# Altium project Baseboard-v3.1.PrjPcb (part 1 of 8)
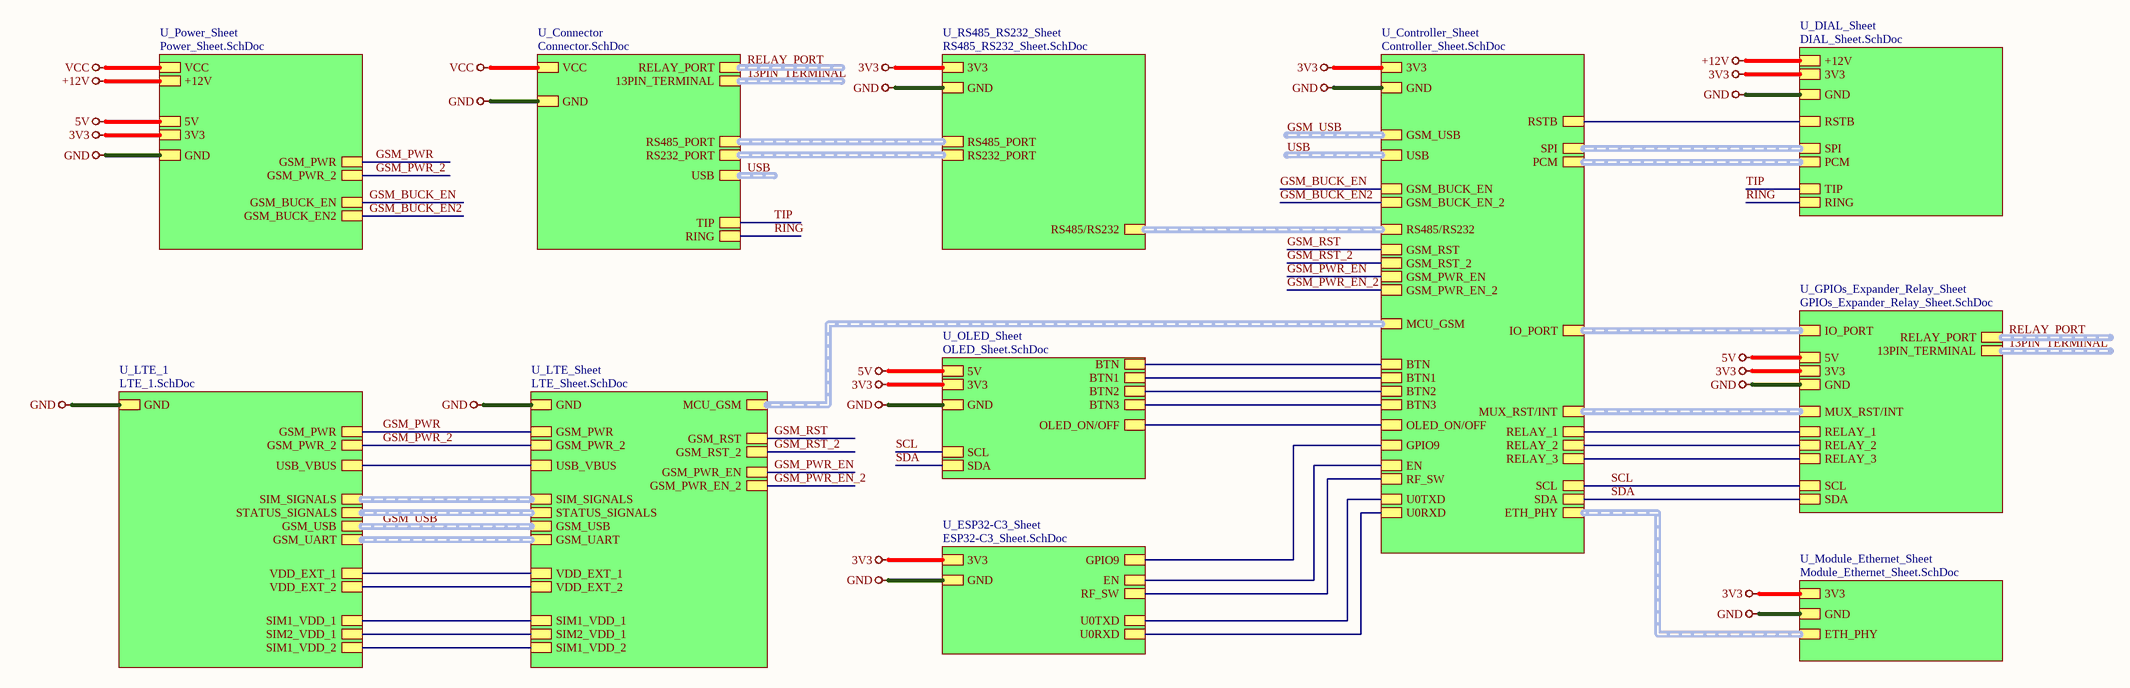
[diagram p0: Top_Sheet.SchDoc]
12 sheets, 417 parts. Net scope: hierarchical (ports join the sheet entries above them; power ports are global).
Board files: Baseboard-Development.PcbDoc, Baseboard-SupervisorCore.PcbDoc, Baseboard-SupervisorDuo.PcbDoc, Baseboard-SupervisorElite.PcbDoc
Sheets:
  Top_Sheet.SchDoc
    U_Connector = Connector.SchDoc
    U_GPIOs_Expander_Relay_Sheet = GPIOs_Expander_Relay_Sheet.SchDoc
    U_OLED_Sheet = OLED_Sheet.SchDoc
    U_Power_Sheet = Power_Sheet.SchDoc
    U_RS485_RS232_Sheet = RS485_RS232_Sheet.SchDoc
    U_Controller_Sheet = Controller_Sheet.SchDoc
    U_LTE_Sheet = LTE_Sheet.SchDoc
    U_LTE_1 = LTE_1.SchDoc
    U_ESP32-C3_Sheet = ESP32-C3_Sheet.SchDoc
    U_DIAL_Sheet = DIAL_Sheet.SchDoc
    U_Module_Ethernet_Sheet = Module_Ethernet_Sheet.SchDoc

## Sheet Top_Sheet.SchDoc
size 420 x 297 mm; SheetNumber: 1; SheetTotal: 12

### Sub-sheets
U_Connector = Connector.SchDoc: VCC, GND, RS485_PORT (harness RS485_PORT), RS232_PORT (harness RS232_PORT), RELAY_PORT (harness RELAY_PORT), 13PIN_TERMINAL (harness 13PIN_TERMINAL), TIP, RING, USB (harness USB)
U_Controller_Sheet = Controller_Sheet.SchDoc: RS485/RS232 (harness RS485/RS232), GND, 3V3, MUX_RST/INT (harness MUX_RST/INT), GSM_USB (harness GSM_USB), ETH_PHY (harness ETH_PHY), GSM_BUCK_EN, GSM_PWR_EN, GSM_RST, RELAY_1, RELAY_2, RELAY_3, MCU_GSM (harness MCU_GSM), GSM_BUCK_EN_2, GSM_PWR_EN_2, GSM_RST_2, RF_SW, EN, BTN1, BTN2, BTN3, OLED_ON/OFF, SCL, SDA, U0RXD, U0TXD, SPI (harness SPI), IO_PORT (harness IO_PORT), PCM (harness PCM), GPIO9, BTN, USB (harness USB), RSTB
U_DIAL_Sheet = DIAL_Sheet.SchDoc: GND, 3V3, +12V, SPI (harness SPI), TIP, RING, PCM (harness PCM), RSTB
U_ESP32-C3_Sheet = ESP32-C3_Sheet.SchDoc: GPIO9, RF_SW, EN, U0RXD, U0TXD, 3V3, GND
U_GPIOs_Expander_Relay_Sheet = GPIOs_Expander_Relay_Sheet.SchDoc: 3V3, GND, 5V, RELAY_PORT (harness RELAY_PORT), 13PIN_TERMINAL (harness 13PIN_TERMINAL), MUX_RST/INT (harness MUX_RST/INT), RELAY_1, RELAY_2, RELAY_3, SCL, SDA, IO_PORT (harness PCM)
U_LTE_1 = LTE_1.SchDoc: SIM_SIGNALS (harness SIM_SIGNALS), SIM1_VDD_1, STATUS_SIGNALS (harness STATUS_SIGNALS), GSM_UART (harness GSM_UART), GSM_PWR, GSM_USB (harness GSM_USB), VDD_EXT_1, GND, USB_VBUS, GSM_PWR_2, SIM2_VDD_1, VDD_EXT_2, SIM1_VDD_2
U_LTE_Sheet = LTE_Sheet.SchDoc: SIM_SIGNALS (harness SIM_SIGNALS), GSM_UART (harness GSM_UART), GSM_PWR, MCU_GSM (harness MCU_GSM), GSM_PWR_EN, GSM_RST, USB_VBUS, GND, STATUS_SIGNALS (harness STATUS_SIGNALS), GSM_PWR_EN_2, GSM_RST_2, GSM_PWR_2, GSM_USB (harness GSM_USB), VDD_EXT_1, VDD_EXT_2, SIM1_VDD_1, SIM2_VDD_1, SIM1_VDD_2
U_Module_Ethernet_Sheet = Module_Ethernet_Sheet.SchDoc: ETH_PHY (harness ETH_PHY), GND, 3V3
U_OLED_Sheet = OLED_Sheet.SchDoc: BTN1, BTN2, BTN3, 3V3, GND, OLED_ON/OFF, SCL, SDA, 5V, BTN
U_Power_Sheet = Power_Sheet.SchDoc: VCC, GND, GSM_BUCK_EN, GSM_PWR, 5V, 3V3, GSM_PWR_2, GSM_BUCK_EN2, +12V
U_RS485_RS232_Sheet = RS485_RS232_Sheet.SchDoc: GND, RS485_PORT (harness RS485_PORT), RS232_PORT (harness RS232_PORT), 3V3, RS485/RS232 (harness RS485/RS232)

### Nets
3V3: sheet U_GPIOs_Expander_Relay_Sheet/3V3, sheet U_OLED_Sheet/3V3, sheet U_Power_Sheet/3V3, sheet U_RS485_RS232_Sheet/3V3, sheet U_Controller_Sheet/3V3, sheet U_ESP32-C3_Sheet/3V3, sheet U_DIAL_Sheet/3V3, sheet U_Module_Ethernet_Sheet/3V3
5V: sheet U_GPIOs_Expander_Relay_Sheet/5V, sheet U_OLED_Sheet/5V, sheet U_Power_Sheet/5V
+12V: sheet U_Power_Sheet/+12V, sheet U_DIAL_Sheet/+12V
GND: sheet U_Connector/GND, sheet U_GPIOs_Expander_Relay_Sheet/GND, sheet U_OLED_Sheet/GND, sheet U_Power_Sheet/GND, sheet U_RS485_RS232_Sheet/GND, sheet U_Controller_Sheet/GND, sheet U_LTE_Sheet/GND, sheet U_LTE_1/GND, sheet U_ESP32-C3_Sheet/GND, sheet U_DIAL_Sheet/GND, sheet U_Module_Ethernet_Sheet/GND
GSM_PWR: sheet U_Power_Sheet/GSM_PWR, sheet U_LTE_Sheet/GSM_PWR, sheet U_LTE_1/GSM_PWR
GSM_PWR_2: sheet U_Power_Sheet/GSM_PWR_2, sheet U_LTE_Sheet/GSM_PWR_2, sheet U_LTE_1/GSM_PWR_2
SIM1_VDD_1: sheet U_LTE_Sheet/SIM1_VDD_1, sheet U_LTE_1/SIM1_VDD_1
SIM1_VDD_2: sheet U_LTE_Sheet/SIM1_VDD_2, sheet U_LTE_1/SIM1_VDD_2
SIM2_VDD_1: sheet U_LTE_Sheet/SIM2_VDD_1, sheet U_LTE_1/SIM2_VDD_1
USB_VBUS: sheet U_LTE_Sheet/USB_VBUS, sheet U_LTE_1/USB_VBUS
VCC: sheet U_Connector/VCC, sheet U_Power_Sheet/VCC
VDD_EXT_1: sheet U_LTE_Sheet/VDD_EXT_1, sheet U_LTE_1/VDD_EXT_1
VDD_EXT_2: sheet U_LTE_Sheet/VDD_EXT_2, sheet U_LTE_1/VDD_EXT_2
BTN: sheet U_OLED_Sheet/BTN, sheet U_Controller_Sheet/BTN
BTN1: sheet U_OLED_Sheet/BTN1, sheet U_Controller_Sheet/BTN1
BTN2: sheet U_OLED_Sheet/BTN2, sheet U_Controller_Sheet/BTN2
BTN3: sheet U_OLED_Sheet/BTN3, sheet U_Controller_Sheet/BTN3
EN: sheet U_Controller_Sheet/EN, sheet U_ESP32-C3_Sheet/EN
GPIO9: sheet U_Controller_Sheet/GPIO9, sheet U_ESP32-C3_Sheet/GPIO9
GSM_BUCK_EN: sheet U_Power_Sheet/GSM_BUCK_EN, sheet U_Controller_Sheet/GSM_BUCK_EN
GSM_BUCK_EN2: sheet U_Power_Sheet/GSM_BUCK_EN2, sheet U_Controller_Sheet/GSM_BUCK_EN_2
GSM_PWR_EN: sheet U_Controller_Sheet/GSM_PWR_EN, sheet U_LTE_Sheet/GSM_PWR_EN
GSM_PWR_EN_2: sheet U_Controller_Sheet/GSM_PWR_EN_2, sheet U_LTE_Sheet/GSM_PWR_EN_2
GSM_RST: sheet U_Controller_Sheet/GSM_RST, sheet U_LTE_Sheet/GSM_RST
GSM_RST_2: sheet U_Controller_Sheet/GSM_RST_2, sheet U_LTE_Sheet/GSM_RST_2
OLED_ON/OFF: sheet U_OLED_Sheet/OLED_ON/OFF, sheet U_Controller_Sheet/OLED_ON/OFF
RELAY_1: sheet U_GPIOs_Expander_Relay_Sheet/RELAY_1, sheet U_Controller_Sheet/RELAY_1
RELAY_2: sheet U_GPIOs_Expander_Relay_Sheet/RELAY_2, sheet U_Controller_Sheet/RELAY_2
RELAY_3: sheet U_GPIOs_Expander_Relay_Sheet/RELAY_3, sheet U_Controller_Sheet/RELAY_3
RF_SW: sheet U_Controller_Sheet/RF_SW, sheet U_ESP32-C3_Sheet/RF_SW
RING: sheet U_Connector/RING, sheet U_DIAL_Sheet/RING
RSTB: sheet U_Controller_Sheet/RSTB, sheet U_DIAL_Sheet/RSTB
SCL: sheet U_GPIOs_Expander_Relay_Sheet/SCL, sheet U_OLED_Sheet/SCL, sheet U_Controller_Sheet/SCL
SDA: sheet U_GPIOs_Expander_Relay_Sheet/SDA, sheet U_OLED_Sheet/SDA, sheet U_Controller_Sheet/SDA
TIP: sheet U_Connector/TIP, sheet U_DIAL_Sheet/TIP
U0RXD: sheet U_Controller_Sheet/U0RXD, sheet U_ESP32-C3_Sheet/U0RXD
U0TXD: sheet U_Controller_Sheet/U0TXD, sheet U_ESP32-C3_Sheet/U0TXD

### Buses and harness runs
harness 13PIN_TERMINAL = sheet U_Connector/13PIN_TERMINAL
harness 13PIN_TERMINAL = sheet U_GPIOs_Expander_Relay_Sheet/13PIN_TERMINAL
harness GSM_USB = sheet U_Controller_Sheet/GSM_USB
harness GSM_USB = sheet U_LTE_1/GSM_USB = sheet U_LTE_Sheet/GSM_USB
harness RELAY_PORT = sheet U_Connector/RELAY_PORT
harness RELAY_PORT = sheet U_GPIOs_Expander_Relay_Sheet/RELAY_PORT
harness sheet U_Connector/RS232_PORT = sheet U_RS485_RS232_Sheet/RS232_PORT
harness sheet U_Connector/RS485_PORT = sheet U_RS485_RS232_Sheet/RS485_PORT
harness sheet U_Controller_Sheet/ETH_PHY = sheet U_Module_Ethernet_Sheet/ETH_PHY
harness sheet U_Controller_Sheet/IO_PORT = sheet U_GPIOs_Expander_Relay_Sheet/IO_PORT
harness sheet U_Controller_Sheet/MCU_GSM = sheet U_LTE_Sheet/MCU_GSM
harness sheet U_Controller_Sheet/MUX_RST/INT = sheet U_GPIOs_Expander_Relay_Sheet/MUX_RST/INT
harness sheet U_Controller_Sheet/PCM = sheet U_DIAL_Sheet/PCM
harness sheet U_Controller_Sheet/RS485/RS232 = sheet U_RS485_RS232_Sheet/RS485/RS232
harness sheet U_Controller_Sheet/SPI = sheet U_DIAL_Sheet/SPI
harness sheet U_LTE_1/GSM_UART = sheet U_LTE_Sheet/GSM_UART
harness sheet U_LTE_1/SIM_SIGNALS = sheet U_LTE_Sheet/SIM_SIGNALS
harness sheet U_LTE_1/STATUS_SIGNALS = sheet U_LTE_Sheet/STATUS_SIGNALS
harness USB = sheet U_Connector/USB
harness USB = sheet U_Controller_Sheet/USB

### Notes on the sheet
- File:
- Title:
- Date:
- Page
- Num:
- Total:
- Drawn By: Huzaifa Ali

## Sheet Connector.SchDoc
size A4; SheetNumber: 2; SheetTotal: 12
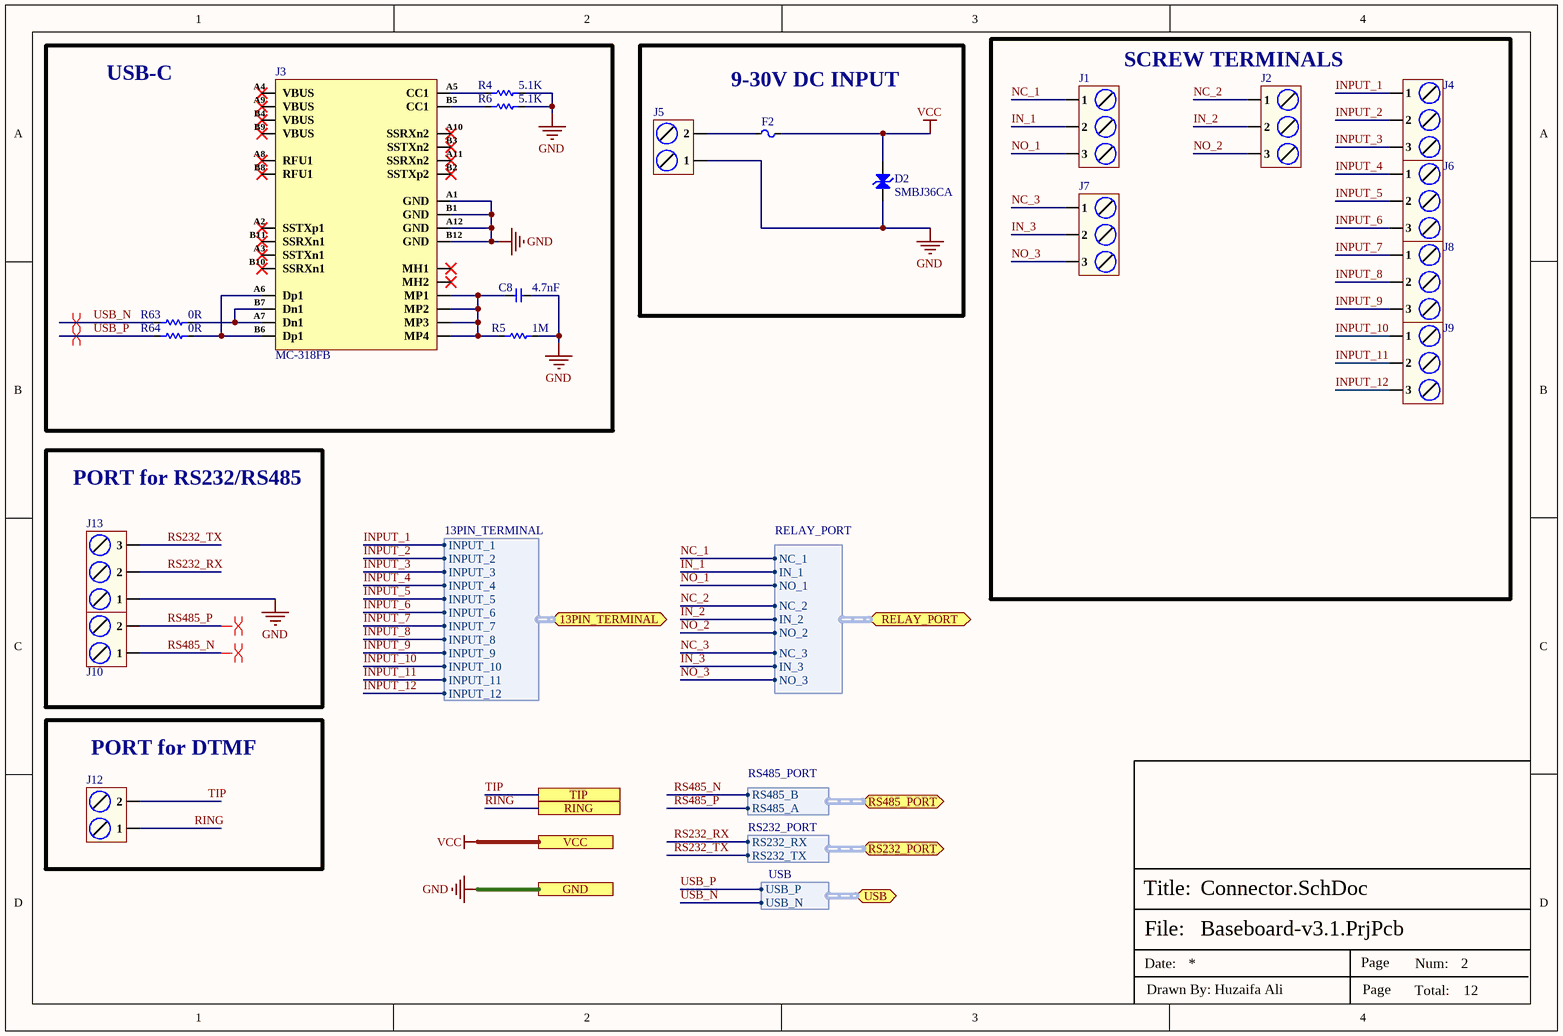
[diagram p1: Connector.SchDoc]

### Parts
C8  4.7nF  [Cap-1206]
D2  SMBJ36CA  [SMB_]
F2  SHV2920P500-30-AA  [Fuse-2920]  (value not drawn)
J1  DB128L-5.08-3P-BK-S  [DB128L-5.08-3P-BK-S]  (value not drawn)
J2  DB128L-5.08-3P-BK-S  [DB128L-5.08-3P-BK-S]  (value not drawn)
J3  MC-318FB  [MC-318FB]
J4  DB128L-5.08-3P-BK-S  [DB128L-5.08-3P-BK-S]  (value not drawn)
J5  DB128L-5.08-2P-BK-S  [DB128L-5.08-2P-BK-S]  (value not drawn)
J6  DB128L-5.08-3P-BK-S  [DB128L-5.08-3P-BK-S]  (value not drawn)
J7  DB128L-5.08-3P-BK-S  [DB128L-5.08-3P-BK-S]  (value not drawn)
J8  DB128L-5.08-3P-BK-S  [DB128L-5.08-3P-BK-S]  (value not drawn)
J9  DB128L-5.08-3P-BK-S  [DB128L-5.08-3P-BK-S]  (value not drawn)
J10  DB128L-5.08-2P-BK-S  [DB128L-5.08-2P-BK-S]  (value not drawn)
J12  DB128L-5.08-2P-BK-S  [DB128L-5.08-2P-BK-S]  (value not drawn)
J13  DB128L-5.08-3P-BK-S  [DB128L-5.08-3P-BK-S]  (value not drawn)
R4  5.1K  [Res-0402]
R5  1M  [Res-0603]
R6  5.1K  [Res-0402]
R63  0R  [Res-0402]
R64  0R  [Res-0402]

### Blocks framed on the sheet
USB-C: C8 J3 R4-R6 R63 R64
9-30V DC INPUT: D2 F2 J5
SCREW TERMINALS: J1 J2 J4 J6-J9
PORT for RS232/RS485: J10 J13
PORT for DTMF: J12

### Ports
13PIN_TERMINAL (bidir, harness 13PIN_TERMINAL), GND, RELAY_PORT (bidir, harness RELAY_PORT), RING, RS232_PORT (bidir, harness RS232_PORT), RS485_PORT (bidir, harness RS485_PORT), TIP, USB (bidir, harness USB), VCC

### Harnesses
RS485_PORT: RS485_B, RS485_A
RS232_PORT: RS232_RX, RS232_TX
RELAY_PORT: NC_1, NC_2, IN_1, IN_2, NO_1, NO_2, NC_3, IN_3, NO_3
13PIN_TERMINAL: INPUT_7, INPUT_1, INPUT_2, INPUT_8, INPUT_3, INPUT_9, INPUT_4, INPUT_10, INPUT_5, INPUT_11, INPUT_6, INPUT_12
USB: USB_P, USB_N

### Nets
GND: C8.1 D2.1(A) J3.A1(GND) J3.A12(GND) J3.B1(GND) J3.B12(GND) J5.1 J13.1 R4.2 R5.1 R6.2 ; port GND
VCC: D2.2(K) F2.2 ; port VCC
IN_1: J1.2 ; port RELAY_PORT.IN_1
IN_2: J2.2 ; port RELAY_PORT.IN_2
IN_3: J7.2 ; port RELAY_PORT.IN_3
INPUT_1: J4.1 ; port 13PIN_TERMINAL.INPUT_1  [project net 13PIN_TERMINAL.INPUT_1]
INPUT_2: J4.2 ; port 13PIN_TERMINAL.INPUT_2  [project net 13PIN_TERMINAL.INPUT_2]
INPUT_3: J4.3 ; port 13PIN_TERMINAL.INPUT_3  [project net 13PIN_TERMINAL.INPUT_3]
INPUT_4: J6.1 ; port 13PIN_TERMINAL.INPUT_4  [project net 13PIN_TERMINAL.INPUT_4]
INPUT_5: J6.2 ; port 13PIN_TERMINAL.INPUT_5  [project net 13PIN_TERMINAL.INPUT_5]
INPUT_6: J6.3 ; port 13PIN_TERMINAL.INPUT_6  [project net 13PIN_TERMINAL.INPUT_6]
INPUT_7: J8.1 ; port 13PIN_TERMINAL.INPUT_7  [project net 13PIN_TERMINAL.INPUT_7]
INPUT_8: J8.2 ; port 13PIN_TERMINAL.INPUT_8  [project net 13PIN_TERMINAL.INPUT_8]
INPUT_9: J8.3 ; port 13PIN_TERMINAL.INPUT_9  [project net 13PIN_TERMINAL.INPUT_9]
INPUT_10: J9.1 ; port 13PIN_TERMINAL.INPUT_10  [project net 13PIN_TERMINAL.INPUT_10]
INPUT_11: J9.2 ; port 13PIN_TERMINAL.INPUT_11  [project net 13PIN_TERMINAL.INPUT_11]
INPUT_12: J9.3 ; port 13PIN_TERMINAL.INPUT_12  [project net 13PIN_TERMINAL.INPUT_12]
NC_1: J1.1 ; port RELAY_PORT.NC_1
NC_2: J2.1 ; port RELAY_PORT.NC_2
NC_3: J7.1 ; port RELAY_PORT.NC_3
NO_1: J1.3 ; port RELAY_PORT.NO_1
NO_2: J2.3 ; port RELAY_PORT.NO_2
NO_3: J7.3 ; port RELAY_PORT.NO_3
RING: J12.1 ; port RING
RS232_RX: J13.2 ; port RS232_PORT.RS232_RX
RS232_TX: J13.3 ; port RS232_PORT.RS232_TX
RS485_N: J10.1 ; port RS485_PORT.RS485_B
RS485_P: J10.2 ; port RS485_PORT.RS485_A
TIP: J12.2 ; port TIP
USB_N: R63.1 ; port USB.USB_N  [project net GSM_USB.GSM_USB_D_N]
USB_P: R64.1 ; port USB.USB_P  [project net GSM_USB.GSM_USB_D_P]
NetC8_2: C8.2 J3.MP1 J3.MP2 J3.MP3 J3.MP4 R5.2
NetF2_1: F2.1 J5.2
NetJ3_A5: J3.A5(CC1) R4.1
NetJ3_A6: J3.A6(Dp1) J3.B6(Dp1) R64.2
NetJ3_A7: J3.A7(Dn1) J3.B7(Dn1) R63.2
NetJ3_B5: J3.B5(CC1) R6.1

Not connected (* = marked no-connect by the designer): J3 A2(SSTXp1)* A3(SSTXn1)* A4(VBUS)* A8(RFU1)* A9(VBUS)* A10(SSRXn2)* A11(SSRXn2)* B2(SSTXp2)* B3(SSTXn2)* B4(VBUS)* B8(RFU1)* B9(VBUS)* B10(SSRXn1)* B11(SSRXn1)* MH1* MH2*

### Layout directives
differential pair; net class RS485; differential pair class RS485_LINES; rule Impedance Constraint [Min = 115.0    Max = 120.0    ]; rule Matched Net Lengths [Tolerance = 0.508mm]: RS485_N, RS485_P
differential pair; net class USB; differential pair class USB_Lines; rule Impedance Constraint [Min = 88.00    Max = 90.00    ]; rule Matched Net Lengths [Tolerance = 20mil]: GSM_USB.GSM_USB_D_N, GSM_USB.GSM_USB_D_P

### Notes on the sheet
- File:
- Title:
- Date:
- Page
- Num:
- Total:
- Drawn By: Huzaifa Ali

### Library data of the parts
C8 = CC1206KKX7RCBB472: CAP CER 4700PF 1KV X7R 1206; Manufacturer: Yageo; Dielectric Material: Ceramic; Tolerance: 10%; Item Type: Capacitor; Supplier 1: Future Electronics; Manufacturer Part Number: CC1206KKX7RCBB472; RoHS: Yes; Category: Ceramic Capacitors; Stock 1: 180000; Pricing 1: 3000=0.02860, 9000=0.02750, 15000=0.02700, 45000=0.02600, 75000=0.02510 (USD); Mount: Surface Mount; Case/Package: 1206; Number of Pins: 2; Case Code (Imperial): 1206; Case Code (Metric): 3216; Weight: 0.000571oz; Min Operating Temperature: -55°C; Max Operating Temperature: 125°C; Voltage Rating: 1kV; Capacitance: 4.7nF; Packaging: Tape and Reel; Voltage Rating (DC): 1kV; Dielectric: X7R; Termination: SMD/SMT; Resistor Type: Ceramic; Series: CC; Length: 3.2mm; Width: 0.063inch; Thickness: 0.057inch; Depth: 1.6mm; Radiation Hardening: No; Lead Free: Lead Free; RoHS Compliant: Yes; ComponentLink1URL: https://datasheet.ciiva.com/13208/upy-gp-np0-16v-to-50v-8-13208693.pdf?src-supplier=Mouser; ComponentLink1Description: https://datasheet.ciiva.com/13208/upy-gp-np0-16v-to-50v-8-13208693.pdf?src-supplier=Mouser; ComponentLink2URL: https://datasheet.ciiva.com/11466/hv-11466701.pdf?src-supplier=Avnet; ComponentLink2Description: https://datasheet.ciiva.com/11466/hv-11466701.pdf?src-supplier=Avnet; Supplier Part Number 1: 7130131; LCSC Part Number: C107198
D2 = SMBJ36CA: 58.1V 40V 36V Bi-Directional SMB(DO-214AA) TVS ROHS; Manufacturer: Slkor(SLKORMICRO Elec.); Item Type: Diode; Manufacturer Part Number: SMBJ36CA; Package: SMB(DO-214AA); LCSC Part Number: C556189; ComponentLink1Description: LCSC; ComponentLink1URL: https://www.lcsc.com/product-detail/span-style-background-color-ff0-TVS-span_Slkor-SLKORMICRO-Elec-SMBJ36CA_C556189.html
F2 = SHV2920P500-30-AA: 30V 5A 5A 2920 Resettable Fuses ROHS; Manufacturer: PTTC(Polytronics Tech); Item Type: Fuse; ComponentLink1Description: LCSC; ComponentLink1URL: https://www.lcsc.com/product-detail/Resettable-Fuses_PTTC-Polytronics-Tech-SHV2920P500-30-AA_C495350.html; Manufacturer Part Number: SHV2920P500-30-AA; Package: 2920; LCSC Part Number: C495350
J1 J2 J4 J6-J9 J13 = DB128L-5.08-3P-BK-S: 1x3P 18A -40℃~+105℃ 250V Black 12~30 Straight pin 5.08mm 2.5 1 3 Plugin,P=5.08mm Screw terminal ROHS; Manufacturer: DIBO; Item Type: Terminal Block; Manufacturer Part Number: DB128L-5.08-3P-BK-S; Package: Plugin,P=5.08mm; LCSC Part Number: C430602; ComponentLink1Description: LCSC; ComponentLink1URL: https://www.lcsc.com/product-detail/Screw-terminal_DIBO-DB128L-5-08-3P-BK-S_C430602.html
J3 = MC-318FB: USB 3.0 3A 1 Brick nogging 24 Female -35℃~+75℃ Type-C SMD USB Connectors ROHS; Manufacturer: SOFNG; ComponentLink1Description: LCSC; ComponentLink1URL: https://www.lcsc.com/product-detail/USB-Connectors_SOFNG-MC-318FB_C2977724.html; Manufacturer Part Number: MC-318FB; Footprint: Custom; LCSC Part Number: C2977724
J5 J10 J12 = DB128L-5.08-2P-BK-S: 1x2P 18A -40℃~+105℃ 250V Black 12~30 Straight pin 5.08mm 2.5 1 2 Plugin,P=5.08mm Screw terminal ROHS; Manufacturer: DIBO; Item Type: Terminal Block; Manufacturer Part Number: DB128L-5.08-2P-BK-S; Package: Plugin,P=5.08mm; LCSC Part Number: C430601; ComponentLink1Description: LCSC; ComponentLink1URL: https://www.lcsc.com/product-detail/Screw-terminal_span-style-background-color-ff0-DIBO-span-DB128L-5-08-2P-BK-S_C430601.html
R4 R6 = RC0402FR-075K1L: RES 5.1K OHM 1% 1/16W 0402; Manufacturer: Yageo; Power Rating: 63mW; Resistance: 5.1kR; Temperature Coefficient: 100ppm/°C; Voltage Rating: 50V; Item Type: Resistor; Supplier 1: Avnet; Manufacturer Part Number: RC0402FR-075K1L; RoHS: Yes; Category: Chip SMD Resistors; Stock 1: 65000; Pricing 1: 10000=0.00085 (USD); Case/Package: 0402; Case Code (Metric): 1005; Case Code (Imperial): 0402; Min Operating Temperature: -55°C; Max Operating Temperature: 155°C; Tolerance: 1%; Technology: THICK FILM; Packaging: Tape and Reel; Package Quantity: 1; Resistor Type: Thick Film; Number of Terminations: 2; Termination: SMD/SMT; Max Power Dissipation: 63mW; Voltage Rating (DC): 50V; Working Voltage: 50V; Features: Moisture Resistant; Series: RC; Resistance Tolerance: 1%; Construction: Rectangular; Length: 1mm; Width: 0.02inch; Height: 0.016inch; Depth: 0.5mm; RoHS Compliant: Yes; Military Standard: Not; Lead Free: Lead Free; ComponentLink1URL: https://datasheet.ciiva.com/7983/1018594-7983519.pdf?src-supplier=Element14; ComponentLink1Description: https://datasheet.ciiva.com/7983/1018594-7983519.pdf?src-supplier=Element14; ComponentLink2URL: https://datasheet.ciiva.com/46394/1018594-46394936.pdf?src-supplier=Element14; ComponentLink2Description: https://datasheet.ciiva.com/46394/1018594-46394936.pdf?src-supplier=Element14; ComponentLink3URL: https://datasheet.ciiva.com/2453/pyu-r-int-thick-7-2453401.pdf?src-supplier=Digi-Key; ComponentLink3Description: https://datasheet.ciiva.com/2453/pyu-r-int-thick-7-2453401.pdf?src-supplier=Digi-Key; ComponentLink4URL: https://datasheet.ciiva.com/2453/pyu-r-int-thick-7-2453402.pdf?src-supplier=Digi-Key; ComponentLink4Description: https://datasheet.ciiva.com/2453/pyu-r-int-thick-7-2453402.pdf?src-supplier=Digi-Key; ComponentLink5URL: https://datasheet.ciiva.com/2453/pyu-r-int-thick-7-2453400.pdf?src-supplier=Digi-Key; ComponentLink5Description: https://datasheet.ciiva.com/2453/pyu-r-int-thick-7-2453400.pdf?src-supplier=Digi-Key; ComponentLink6URL: https://datasheet.ciiva.com/12558/pyu-rc0402-51-rohs-l-6-r-8721-12558460.pdf?src-supplier=Mouser; ComponentLink6Description: https://datasheet.ciiva.com/12558/pyu-rc0402-51-rohs-l-6-r-8721-12558460.pdf?src-supplier=Mouser; ComponentLink7URL: https://datasheet.ciiva.com/16744/pyu-rc0402-51-rohs-l-6-r-16744283.pdf?src-supplier=Future+Electronics; ComponentLink7Description: https://datasheet.ciiva.com/16744/pyu-rc0402-51-rohs-l-6-r-16744283.pdf?src-supplier=Future+Electronics; ComponentLink8URL: https://datasheet.ciiva.com/15189/getdatasheetpartid-323636-15189493.pdf?src-supplier=Verical; ComponentLink8Description: https://datasheet.ciiva.com/15189/getdatasheetpartid-323636-15189493.pdf?src-supplier=Verical; Supplier Part Number 1: RC0402FR-075K1L; LCSC Part Number: C105872
R5 = RC0603FR-071ML: RES SMD 1M OHM 1% 1/10W 0603; Manufacturer: Yageo; Voltage Rating: 50V; Resistance: 1MR; Power Rating: 100mW; Temperature Coefficient: 100ppm/°C; Item Type: Resistor; Supplier 1: Digi-Key; Manufacturer Part Number: RC0603FR-071ML; Stock 1: 3824601; Pricing 1: 1=0.1, 10=0.023, 100=0.0094, 1000=0.00421, 2500=0.00366 (USD); Case/Package: 0603; Number of Pins: 2; Case Code (Imperial): 0603; Case Code (Metric): 1608; Min Operating Temperature: -55°C; Max Operating Temperature: 155°C; Voltage Rating (DC): 50V; Tolerance: 1%; Packaging: Tape and Reel; Package Quantity: 5000; Termination: SMD/SMT; Composition: Thick Film; Military Standard: Not; Length: 1.6mm; Height: 0.45mm; Width: 0.8mm; Depth: 0.8mm; REACH SVHC: No SVHC; Lead Free: Lead Free; ComponentLink1URL: http://www.farnell.com/datasheets/2167052.pdf?src-supplier=Mouser; ComponentLink1Description: http://www.farnell.com/datasheets/2167052.pdf?src-supplier=Mouser; ComponentLink2URL: http://www.farnell.com/datasheets/2167052.pdf?src-supplier=Element14; ComponentLink2Description: http://www.farnell.com/datasheets/2167052.pdf?src-supplier=Element14; ComponentLink3URL: http://documents.rs-components.com/techlib://itc_doclist_GB.htm?stockno=5048956&src-supplier=RSComponents; ComponentLink3Description: http://documents.rs-components.com/techlib://itc_doclist_GB.htm?stockno=5048956&src-supplier=RSComponents; Supplier Part Number 1: 311-1.00MHRDKR-ND; LCSC Part Number: C105578
R63 R64 = RC0402FR-070RL: RES 0 OHM JUMPER 1/16W 0402; Manufacturer: Yageo; Tolerance: 1%; Power Rating: 62.5mW; Voltage Rating: 50V; Temperature Coefficient: 200ppm/°C; Max Power Dissipation: 63mW; Supplier 1: Mouser; Manufacturer Part Number: RC0402FR-070RL; RoHS: Yes; Category: Chip SMD Resistors; Stock 1: 8556842; Pricing 1: 1=0.10000, 10=0.01400, 50=0.01400, 100=0.00600, 1000=0.00300, 5000=0.00200, 10000=0.00100 (USD); Mount: Surface Mount; Case/Package: 0402; Contact Plating: Tin,Matte; Case Code (Imperial): 0402; Case Code (Metric): 1005; Size Code: 0402; Min Operating Temperature: -55°C; Max Operating Temperature: 155°C; Resistance: 0R; Resistor Type: Thick Film; Packaging: Tape and Reel; Termination: SMD/SMT; Features: Moisture Resistant; Series: RC; Number of Terminations: 2; Length: 1mm; Width: 0.5mm; Height: 0.35mm; Radiation Hardening: No; Lead Free: Lead Free; RoHS Compliant: Yes; ComponentLink1URL: https://datasheet.ciiva.com/8896/pyu-rc0402-51-rohs-l-6-8896149.pdf?src-supplier=Avnet; ComponentLink1Description: https://datasheet.ciiva.com/8896/pyu-rc0402-51-rohs-l-6-8896149.pdf?src-supplier=Avnet; ComponentLink2URL: https://datasheet.ciiva.com/16790/pyu-rc0402-51-rohs-l-6-r-16790444.pdf?src-supplier=Future+Electronics; ComponentLink2Description: https://datasheet.ciiva.com/16790/pyu-rc0402-51-rohs-l-6-r-16790444.pdf?src-supplier=Future+Electronics; Supplier Part Number 1: 603-RC0402FR-070RL; LCSC Part Number: C106231

## Sheet GPIOs_Expander_Relay_Sheet.SchDoc
size 420 x 297 mm; SheetNumber: 5; SheetTotal: 12
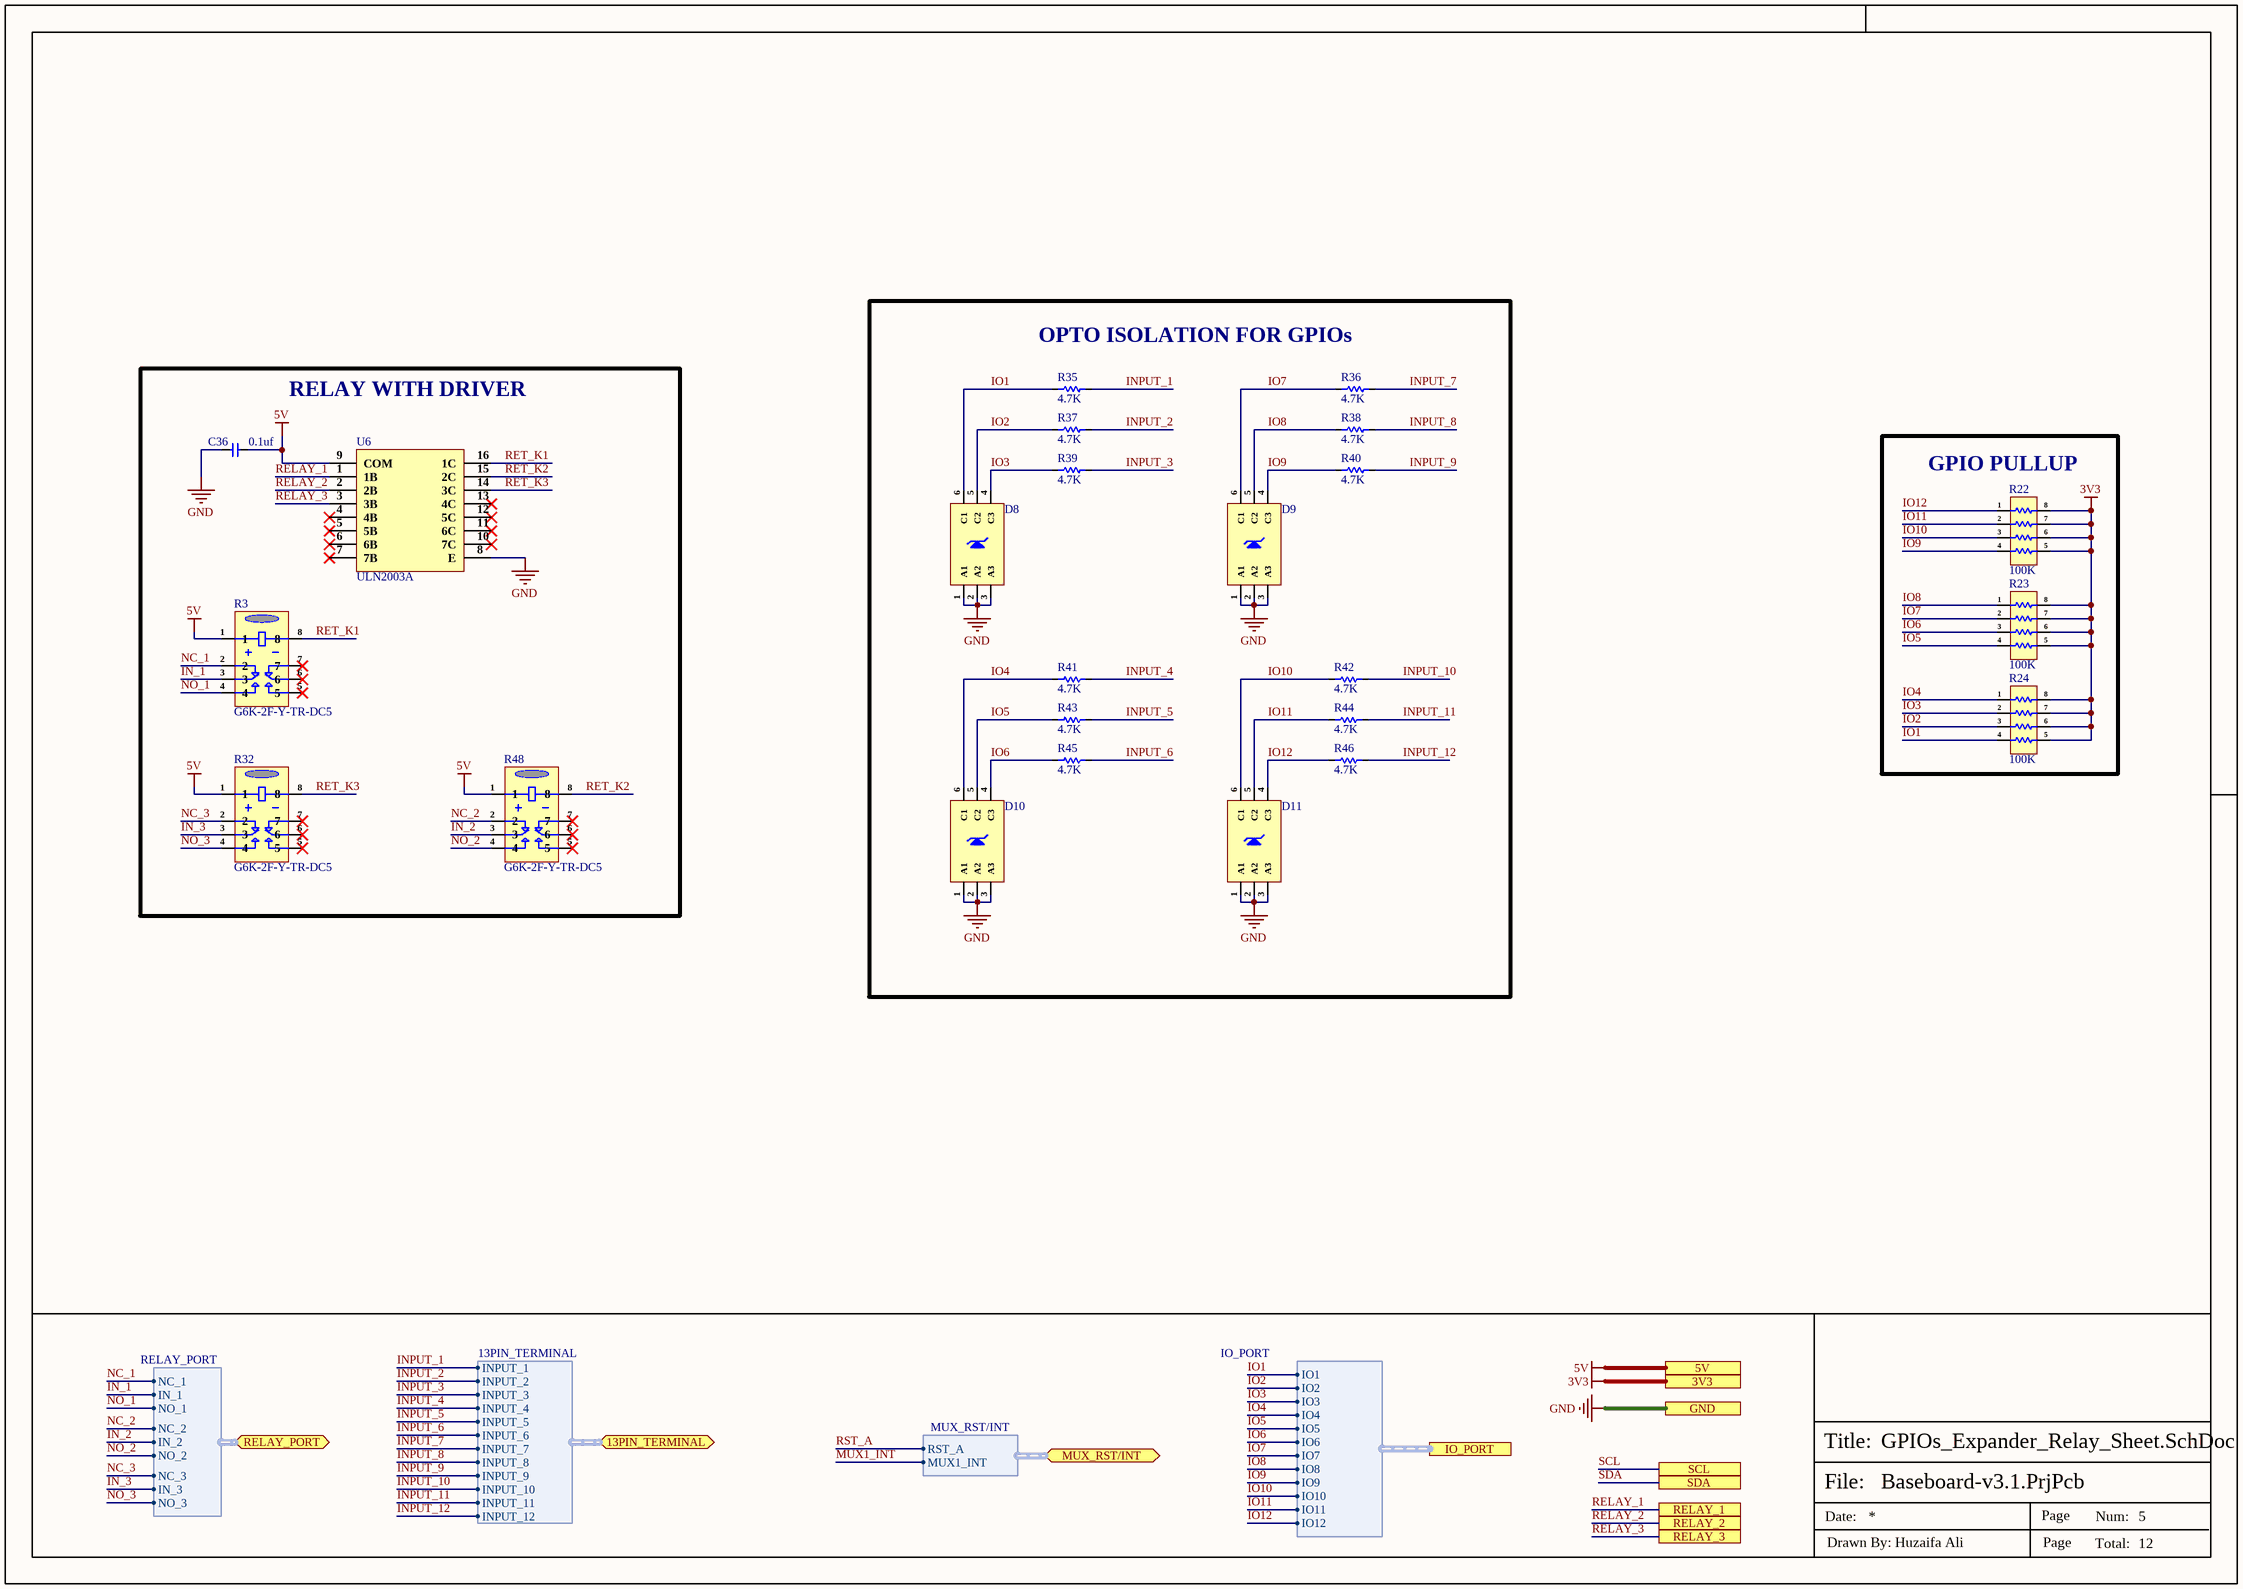
[diagram p2: GPIOs_Expander_Relay_Sheet.SchDoc]

### Parts
C36  0.1uf  [Cap-0402]
D8  BZX84C3V3TS-7-F  [SOT-363]  (value not drawn)
D9  BZX84C3V3TS-7-F  [SOT-363]  (value not drawn)
D10  BZX84C3V3TS-7-F  [SOT-363]  (value not drawn)
D11  BZX84C3V3TS-7-F  [SOT-363]  (value not drawn)
R3  G6K-2F-Y-TR-DC5  [G6K-2F-Y-TR DC5]
R22  100K  [YC164-JR-070RL]
R23  100K  [YC164-JR-070RL]
R24  100K  [YC164-JR-070RL]
R32  G6K-2F-Y-TR-DC5  [G6K-2F-Y-TR DC5]
R35  4.7K  [Res-0402]
R36  4.7K  [Res-0402]
R37  4.7K  [Res-0402]
R38  4.7K  [Res-0402]
R39  4.7K  [Res-0402]
R40  4.7K  [Res-0402]
R41  4.7K  [Res-0402]
R42  4.7K  [Res-0402]
R43  4.7K  [Res-0402]
R44  4.7K  [Res-0402]
R45  4.7K  [Res-0402]
R46  4.7K  [Res-0402]
R48  G6K-2F-Y-TR-DC5  [G6K-2F-Y-TR DC5]
U6  ULN2003A  [SOP-16_150mil]

### Blocks framed on the sheet
OPTO ISOLATION FOR GPIOs: D8-D11 R35-R46
RELAY WITH DRIVER: C36 R3 R32 R48 U6
GPIO PULLUP: R22-R24

### Ports
3V3, 5V, 13PIN_TERMINAL (bidir, harness 13PIN_TERMINAL), GND, IO_PORT (harness IO_PORT), MUX_RST/INT (bidir, harness MUX_RST/INT), RELAY_1, RELAY_2, RELAY_3, RELAY_PORT (bidir, harness RELAY_PORT), SCL, SDA

### Harnesses
RELAY_PORT: NC_1, NC_2, IN_1, IN_2, NO_1, NO_2, NC_3, IN_3, NO_3
13PIN_TERMINAL: INPUT_7, INPUT_1, INPUT_2, INPUT_8, INPUT_3, INPUT_9, INPUT_4, INPUT_10, INPUT_5, INPUT_11, INPUT_6, INPUT_12
MUX_RST/INT: RST_A, MUX1_INT
IO_PORT: IO1, IO2, IO3, IO4, IO5, IO6, IO7, IO9, IO10, IO11, IO12, IO8

### Nets
3V3: R22.5 R22.6 R22.7 R22.8 R23.5 R23.6 R23.7 R23.8 R24.5 R24.6 R24.7 R24.8 ; port 3V3
5V: C36.1 R3.1 R32.1 R48.1 U6.9(COM) ; port 5V
GND: C36.2 D8.1(A1) D8.2(A2) D8.3(A3) D9.1(A1) D9.2(A2) D9.3(A3) D10.1(A1) D10.2(A2) D10.3(A3) D11.1(A1) D11.2(A2) D11.3(A3) U6.8(E) ; port GND
IN_1: R3.3 ; port RELAY_PORT.IN_1
IN_2: R48.3 ; port RELAY_PORT.IN_2
IN_3: R32.3 ; port RELAY_PORT.IN_3
INPUT_1: R35.2 ; port 13PIN_TERMINAL.INPUT_1  [project net 13PIN_TERMINAL.INPUT_1]
INPUT_2: R37.2 ; port 13PIN_TERMINAL.INPUT_2  [project net 13PIN_TERMINAL.INPUT_2]
INPUT_3: R39.2 ; port 13PIN_TERMINAL.INPUT_3  [project net 13PIN_TERMINAL.INPUT_3]
INPUT_4: R41.2 ; port 13PIN_TERMINAL.INPUT_4  [project net 13PIN_TERMINAL.INPUT_4]
INPUT_5: R43.2 ; port 13PIN_TERMINAL.INPUT_5  [project net 13PIN_TERMINAL.INPUT_5]
INPUT_6: R45.2 ; port 13PIN_TERMINAL.INPUT_6  [project net 13PIN_TERMINAL.INPUT_6]
INPUT_7: R36.2 ; port 13PIN_TERMINAL.INPUT_7  [project net 13PIN_TERMINAL.INPUT_7]
INPUT_8: R38.2 ; port 13PIN_TERMINAL.INPUT_8  [project net 13PIN_TERMINAL.INPUT_8]
INPUT_9: R40.2 ; port 13PIN_TERMINAL.INPUT_9  [project net 13PIN_TERMINAL.INPUT_9]
INPUT_10: R42.2 ; port 13PIN_TERMINAL.INPUT_10  [project net 13PIN_TERMINAL.INPUT_10]
INPUT_11: R44.2 ; port 13PIN_TERMINAL.INPUT_11  [project net 13PIN_TERMINAL.INPUT_11]
INPUT_12: R46.2 ; port 13PIN_TERMINAL.INPUT_12  [project net 13PIN_TERMINAL.INPUT_12]
IO1: D8.6(C1) R24.4 R35.1 ; port IO_PORT.IO1
IO2: D8.5(C2) R24.3 R37.1 ; port IO_PORT.IO2
IO3: D8.4(C3) R24.2 R39.1 ; port IO_PORT.IO3
IO4: D10.6(C1) R24.1 R41.1 ; port IO_PORT.IO4
IO5: D10.5(C2) R23.4 R43.1 ; port IO_PORT.IO5
IO6: D10.4(C3) R23.3 R45.1 ; port IO_PORT.IO6
IO7: D9.6(C1) R23.2 R36.1 ; port IO_PORT.IO7
IO8: D9.5(C2) R23.1 R38.1 ; port IO_PORT.IO8
IO9: D9.4(C3) R22.4 R40.1 ; port IO_PORT.IO9
IO10: D11.6(C1) R22.3 R42.1 ; port IO_PORT.IO10
IO11: D11.5(C2) R22.2 R44.1 ; port IO_PORT.IO11
IO12: D11.4(C3) R22.1 R46.1 ; port IO_PORT.IO12
MUX1_INT: port MUX_RST/INT.MUX1_INT
NC_1: R3.2 ; port RELAY_PORT.NC_1
NC_2: R48.2 ; port RELAY_PORT.NC_2
NC_3: R32.2 ; port RELAY_PORT.NC_3
NO_1: R3.4 ; port RELAY_PORT.NO_1
NO_2: R48.4 ; port RELAY_PORT.NO_2
NO_3: R32.4 ; port RELAY_PORT.NO_3
RELAY_1: U6.1(1B) ; port RELAY_1
RELAY_2: U6.2(2B) ; port RELAY_2
RELAY_3: U6.3(3B) ; port RELAY_3
RET_K1: R3.8 U6.16(1C)
RET_K2: R48.8 U6.15(2C)
RET_K3: R32.8 U6.14(3C)
RST_A: port MUX_RST/INT.RST_A

Not connected (* = marked no-connect by the designer): R3 5* 6* 7*; R32 5* 6* 7*; R48 5* 6* 7*; U6 4(4B)* 5(5B)* 6(6B)* 7(7B)* 10(7C)* 11(6C)* 12(5C)* 13(4C)*

### Notes on the sheet
- File:
- Title:
- Date:
- Page
- Num:
- Total:
- Drawn By: Huzaifa Ali

### Library data of the parts
C36 = GRM155R62A104KE14D: CAP CER 0.1UF 100V X5R 0402; Manufacturer: Murata; Capacitance: 100nF; Tolerance: 10%; Item Type: Capacitor; Supplier 1: Arrow Electronics; Manufacturer Part Number: GRM155R62A104KE14D; RoHS: Yes; Category: Ceramic Capacitors; Stock 1: 870000; Pricing 1: 10000=0.00500, 20000=0.00410, 30000=0.00390, 50000=0.00370, 100000=0.00300 (USD); Mount: Surface Mount; Case/Package: 0402; Case Code (Metric): 1005; Case Code (Imperial): 0402; Weight: 0.000212oz; Min Operating Temperature: -55°C; Max Operating Temperature: 85°C; Packaging: Tape and Reel; Voltage Rating: 100V; Dielectric: X5R; Termination: SMD/SMT; Voltage Rating (DC): 100V; Package Quantity: 10000; Series: GRM; Length: 0.039inch; Width: 0.02inch; Height: 0.5mm; Thickness: 0.022inch; Reach SVHC Compliant: Yes; Lead Free: Lead Free; RoHS Compliant: Yes; ComponentLink1URL: http://www.farnell.com/datasheets/2079151.pdf?src-supplier=Farnell; ComponentLink1Description: http://www.farnell.com/datasheets/2079151.pdf?src-supplier=Farnell; ComponentLink2URL: http://www.mouser.com/ds/2/281/c02e-2905.pdf?src-supplier=Mouser; ComponentLink2Description: http://www.mouser.com/ds/2/281/c02e-2905.pdf?src-supplier=Mouser; ComponentLink3URL: http://www.farnell.com/datasheets/2079151.pdf?src-supplier=Element14; ComponentLink3Description: http://www.farnell.com/datasheets/2079151.pdf?src-supplier=Element14; ComponentLink4URL: http://search.murata.co.jp/Ceramy/image/img/A01X/G101/ENG/GRM155R62A104KE14-01.pdf?src-supplier=Digi-Key; ComponentLink4Description: http://search.murata.co.jp/Ceramy/image/img/A01X/G101/ENG/GRM155R62A104KE14-01.pdf?src-supplier=Digi-Key; ComponentLink5URL: http://www.farnell.com/datasheets/2079151.pdf?src-supplier=Newark; ComponentLink5Description: http://www.farnell.com/datasheets/2079151.pdf?src-supplier=Newark; Supplier Part Number 1: GRM155R62A104KE14D; LCSC Part Number: C162178
D8-D11 = BZX84C3V3TS-7-F: DIODE ZENER ARRAY 3.3V SOT363; Manufacturer: Diodes Incorporated; Manufacturer Part Number: BZX84C3V3TS-7-F; Package: SOT-363-6; LCSC Part Number: C5124989; Item Type: Diode; ComponentLink1Description: LCSC; ComponentLink1URL: https://www.lcsc.com/product-detail/Zener-Diodes_Diodes-Incorporated-BZX84C3V3TS-7-F_C5124989.html
R3 R32 R48 = G6K-2F-Y-TR-DC5: RELAY TELECOM DPDT 1A 5V; Manufacturer: Omron; Supplier: Digikey; Supplier Part Number: Z128CT-ND; Manufacturer Part Number: G6K-2F-Y-TR-DC5; RoHS: Yes; Category: Signal Relays; Stock: 17486; Pricing: 1=4.49, 10=4.211, 25=3.7428, 50=3.5558, 100=3.3686, 250=2.99428 (USD); ComponentLink1URL: https://datasheet.ciiva.com/2416/en-g6k-2416490.pdf?src-supplier=Digikey; ComponentLink1Description: https://datasheet.ciiva.com/2416/en-g6k-2416490.pdf?src-supplier=Digikey; ComponentLink2URL: https://datasheet.ciiva.com/30094/81en-g6k-30094551.pdf?src-supplier=Onlinecomponents.com; ComponentLink2Description: https://datasheet.ciiva.com/30094/81en-g6k-30094551.pdf?src-supplier=Onlinecomponents.com; LCSC Part Number: C47190; Item Type: Relay
R22-R24 = YC164-JR-07100KL: RES ARRAY 4 RES 100K OHM 1206; Manufacturer: Yageo; Item Type: Resistor; Supplier: Future Electronics; Supplier Part Number: 4734737; Manufacturer Part Number: YC164-JR-07100KL; RoHS: Yes; Category: Resistor Arrays; Stock: 10000; Pricing: 5000=0.0086, 20000=0.0082, 50000=0.0078, 100000=0.0078, 125000=0.0075, 200000=0.0076, 625000=0.0071 (USD); ComponentLink1URL: https://datasheet.ciiva.com/11807/0900766b80c69e1d-11807026.pdf?src-supplier=Rs; ComponentLink1Description: https://datasheet.ciiva.com/11807/0900766b80c69e1d-11807026.pdf?src-supplier=Rs; ComponentLink2URL: https://datasheet.ciiva.com/8017/443424-8017993.pdf?src-supplier=Element14; ComponentLink2Description: https://datasheet.ciiva.com/8017/443424-8017993.pdf?src-supplier=Element14; ComponentLink3URL: https://datasheet.ciiva.com/8017/443424-8017994.pdf?src-supplier=Element14; ComponentLink3Description: https://datasheet.ciiva.com/8017/443424-8017994.pdf?src-supplier=Element14; ComponentLink4URL: https://datasheet.ciiva.com/17478/pyu-yc-tc164-51-rohs-l-3-17478885.pdf?src-supplier=Future+Electronics; ComponentLink4Description: https://datasheet.ciiva.com/17478/pyu-yc-tc164-51-rohs-l-3-17478885.pdf?src-supplier=Future+Electronics; ComponentLink5URL: https://datasheet.ciiva.com/2693/pyu-yc-tc164-51-rohs-l-3-2693249.pdf?src-supplier=Digi-Key; ComponentLink5Description: https://datasheet.ciiva.com/2693/pyu-yc-tc164-51-rohs-l-3-2693249.pdf?src-supplier=Digi-Key; ComponentLink6URL: https://datasheet.ciiva.com/2693/pyu-yc-tc164-51-rohs-l-3-2693250.pdf?src-supplier=Digi-Key; ComponentLink6Description: https://datasheet.ciiva.com/2693/pyu-yc-tc164-51-rohs-l-3-2693250.pdf?src-supplier=Digi-Key; ComponentLink7URL: https://datasheet.ciiva.com/2693/pyu-yc-tc164-51-rohs-l-3-2693251.pdf?src-supplier=Digi-Key; ComponentLink7Description: https://datasheet.ciiva.com/2693/pyu-yc-tc164-51-rohs-l-3-2693251.pdf?src-supplier=Digi-Key; LCSC Part Number: C192933
R35-R46 = RC0402FR-074K7L: RES 4.7K OHM 1% 1/16W 0402; Manufacturer: Yageo; Voltage Rating (DC): 50V; Power Rating: 62.5mW; Resistance: 4.7kR; Temperature Coefficient: 100ppm/°C; Max Power Dissipation: 63mW; Item Type: Resistor; Supplier 1: Avnet; Manufacturer Part Number: RC0402FR-074K7L; RoHS: Yes; Category: Chip SMD Resistors; Stock 1: 2420000; Pricing 1: 10000=0.00085 (USD); Case/Package: 0402; Number of Pins: 2; Case Code (Imperial): 0402; Case Code (Metric): 1005; Size Code: 0402; Min Operating Temperature: -55°C; Max Operating Temperature: 155°C; Tolerance: 1%; Voltage Rating: 50V; Packaging: Tape and Reel; Resistor Type: Thick Film; Termination: SMD/SMT; Features: Moisture Resistant; Series: RC; Number of Terminations: 2; Resistance Tolerance: 1%; Construction: Rectangular; Length: 1mm; Width: 0.5mm; Height: 0.32mm; Depth: 0.5mm; Height - Seated (Max): 0.016inch; RoHS Compliant: Yes; Reach SVHC Compliant: Yes; Military Standard: Not; Lead Free: Lead Free; ComponentLink1URL: https://datasheet.ciiva.com/22661/1686128-22661342.pdf?src-supplier=Element14; ComponentLink1Description: https://datasheet.ciiva.com/22661/1686128-22661342.pdf?src-supplier=Element14; ComponentLink2URL: https://datasheet.ciiva.com/7850/1018594-7850022.pdf?src-supplier=Element14; ComponentLink2Description: https://datasheet.ciiva.com/7850/1018594-7850022.pdf?src-supplier=Element14; ComponentLink3URL: https://datasheet.ciiva.com/7850/1018594-7850023.pdf?src-supplier=Element14; ComponentLink3Description: https://datasheet.ciiva.com/7850/1018594-7850023.pdf?src-supplier=Element14; ComponentLink4URL: https://datasheet.ciiva.com/15215/getdatasheetpartid-328119-15215035.pdf?src-supplier=Verical; ComponentLink4Description: https://datasheet.ciiva.com/15215/getdatasheetpartid-328119-15215035.pdf?src-supplier=Verical; Supplier Part Number 1: RC0402FR-074K7L; LCSC Part Number: C105871
U6 = ULN2003A: 100uA@50V 3V@2V,300mA 1.6V@350mA 4mA@12V 100uA@50V 1.25V@350mA 500mA 25pF SOP-16_150mil Darlington Transistor Arrays ROHS; Manufacturer: Mixic; Item Type: IC; Manufacturer Part Number: ULN2003A; Package: SOP-16_150mil; LCSC Part Number: C181730; ComponentLink1Description: LCSC; ComponentLink1URL: https://www.lcsc.com/product-detail/Darlington-Transistor-Arrays_Mixic-ULN2003A_C181730.html